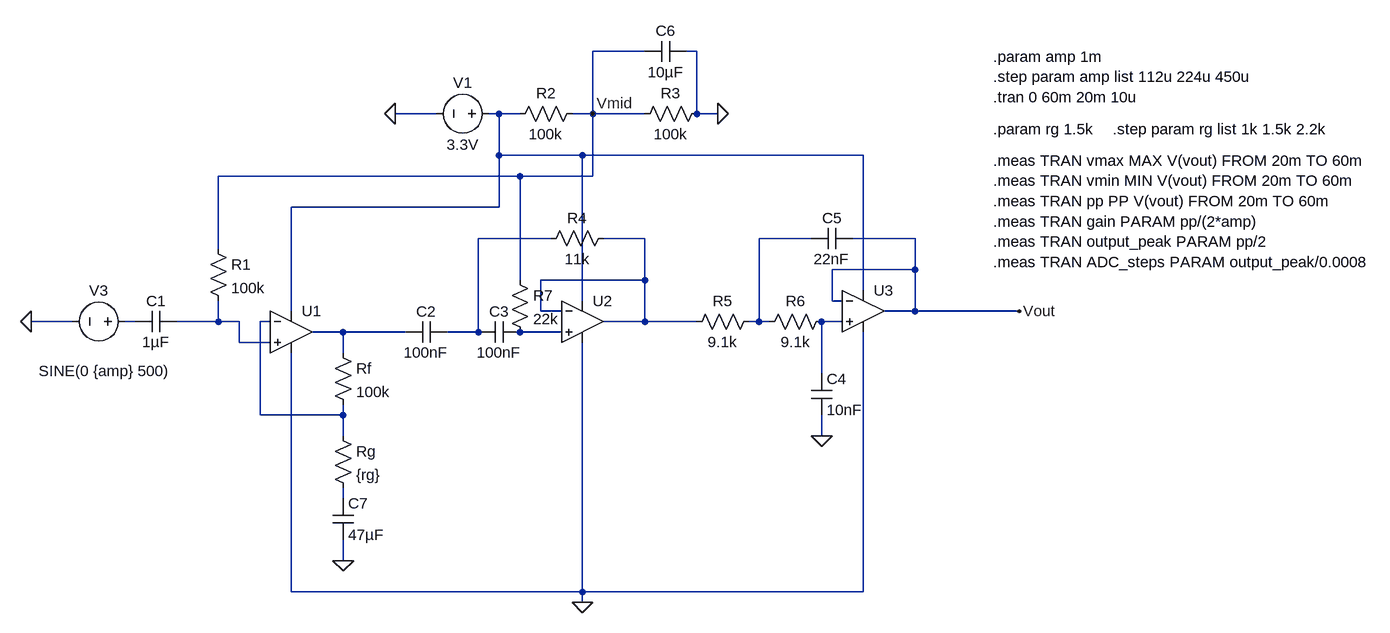
[diagram p0: schematic AUSCULT_AI_Filter - ADC step test with microvolts.asc]
AUSCULT_AI_Filter - ADC step test with microvolts.asc, the LTspice schematic file:
Version 4.1
SHEET 1 1760 680
WIRE 576 -272 496 -272
WIRE 656 -272 640 -272
WIRE 256 -176 192 -176
WIRE 352 -176 336 -176
WIRE 384 -176 352 -176
WIRE 496 -176 496 -272
WIRE 496 -176 464 -176
WIRE 576 -176 496 -176
WIRE 656 -176 656 -272
WIRE 688 -176 656 -176
WIRE 352 -112 352 -176
WIRE 480 -112 352 -112
WIRE 912 -112 480 -112
WIRE 384 -80 -80 -80
WIRE 496 -80 496 -176
WIRE 496 -80 384 -80
WIRE 352 -32 352 -112
WIRE 352 -32 32 -32
WIRE 432 16 320 16
WIRE 576 16 512 16
WIRE 832 16 752 16
WIRE 992 16 896 16
WIRE -80 32 -80 -80
WIRE 992 64 992 16
WIRE 992 64 864 64
WIRE 384 80 384 -80
WIRE 576 80 576 16
WIRE 576 80 416 80
WIRE 912 96 912 -112
WIRE 480 112 480 -112
WIRE 864 112 864 64
WIRE 880 112 864 112
WIRE 32 128 32 -32
WIRE 416 128 416 80
WIRE 448 128 416 128
WIRE 992 128 992 64
WIRE 992 128 944 128
WIRE 1152 128 992 128
WIRE -304 144 -368 144
WIRE -208 144 -224 144
WIRE -80 144 -80 112
WIRE -80 144 -144 144
WIRE -48 144 -80 144
WIRE 0 144 -16 144
WIRE 576 144 576 80
WIRE 576 144 512 144
WIRE 656 144 576 144
WIRE 752 144 752 16
WIRE 752 144 736 144
WIRE 768 144 752 144
WIRE 880 144 848 144
WIRE 112 160 64 160
WIRE 208 160 112 160
WIRE 320 160 320 16
WIRE 320 160 272 160
WIRE 448 160 384 160
WIRE -48 176 -48 144
WIRE 0 176 -48 176
WIRE 112 192 112 160
WIRE 848 224 848 144
WIRE -16 288 -16 144
WIRE 112 288 112 272
WIRE 112 288 -16 288
WIRE 112 320 112 288
WIRE 848 320 848 288
WIRE 112 416 112 400
WIRE 112 512 112 480
WIRE 32 560 32 192
WIRE 480 560 480 176
WIRE 480 560 32 560
WIRE 912 560 912 160
WIRE 912 560 480 560
WIRE 480 576 480 560
FLAG 848 320 0
FLAG 1152 128 Vout
FLAG -368 144 0
FLAG 480 576 0
FLAG 112 512 0
FLAG 688 -176 0
FLAG 496 -176 Vmid
FLAG 192 -176 0
SYMBOL OpAmps\\UniversalOpAmp2 32 160 R0
SYMATTR InstName U1
SYMBOL OpAmps\\UniversalOpAmp2 480 144 R0
SYMATTR InstName U2
SYMBOL OpAmps\\UniversalOpAmp2 912 128 R0
SYMATTR InstName U3
SYMBOL cap -144 128 R90
WINDOW 0 0 32 VBottom 2
WINDOW 3 32 32 VTop 2
SYMATTR InstName C1
SYMATTR Value 1µF
SYMBOL res -96 16 R0
SYMATTR InstName R1
SYMATTR Value 100k
SYMBOL res 96 176 R0
SYMATTR InstName Rf
SYMATTR Value 100k
SYMBOL res 96 304 R0
SYMATTR InstName Rg
SYMATTR Value {rg}
SYMBOL cap 272 144 R90
WINDOW 0 0 32 VBottom 2
WINDOW 3 32 32 VTop 2
SYMATTR InstName C2
SYMATTR Value 100nF
SYMBOL cap 384 144 R90
WINDOW 0 0 32 VBottom 2
WINDOW 3 32 32 VTop 2
SYMATTR InstName C3
SYMATTR Value 100nF
SYMBOL res 528 0 R90
WINDOW 0 0 56 VBottom 2
WINDOW 3 32 56 VTop 2
SYMATTR InstName R4
SYMATTR Value 11k
SYMBOL res 752 128 R90
WINDOW 0 0 56 VBottom 2
WINDOW 3 32 56 VTop 2
SYMATTR InstName R5
SYMATTR Value 9.1k
SYMBOL res 864 128 R90
WINDOW 0 0 56 VBottom 2
WINDOW 3 32 56 VTop 2
SYMATTR InstName R6
SYMATTR Value 9.1k
SYMBOL cap 832 224 R0
SYMATTR InstName C4
SYMATTR Value 10nF
SYMBOL cap 896 0 R90
WINDOW 0 0 32 VBottom 2
WINDOW 3 32 32 VTop 2
SYMATTR InstName C5
SYMATTR Value 22nF
SYMBOL res 368 64 R0
SYMATTR InstName R7
SYMATTR Value 22k
SYMBOL voltage -208 144 R90
WINDOW 0 -32 56 VBottom 2
WINDOW 3 60 47 VTop 2
WINDOW 123 47 49 VTop 2
WINDOW 39 0 0 Left 0
SYMATTR InstName V3
SYMATTR Value SINE(0 {amp} 500)
SYMBOL voltage 352 -176 R90
WINDOW 0 -32 56 VBottom 2
WINDOW 3 32 56 VTop 2
WINDOW 123 0 0 Left 0
WINDOW 39 0 0 Left 0
SYMATTR InstName V1
SYMATTR Value 3.3V
SYMBOL res 480 -192 R90
WINDOW 0 0 56 VBottom 2
WINDOW 3 32 56 VTop 2
SYMATTR InstName R2
SYMATTR Value 100k
SYMBOL res 672 -192 R90
WINDOW 0 0 56 VBottom 2
WINDOW 3 32 56 VTop 2
SYMATTR InstName R3
SYMATTR Value 100k
SYMBOL cap 640 -288 R90
WINDOW 0 0 32 VBottom 2
WINDOW 3 32 32 VTop 2
SYMATTR InstName C6
SYMATTR Value 10µF
SYMBOL cap 96 416 R0
SYMATTR InstName C7
SYMATTR Value 47µF
TEXT 1112 -264 Left 2 !.param amp 1m\n.step param amp list 112u 224u 450u\n.tran 0 60m 20m 10u
TEXT 1112 -104 Left 2 !.meas TRAN vmax MAX V(vout) FROM 20m TO 60m\n.meas TRAN vmin MIN V(vout) FROM 20m TO 60m\n.meas TRAN pp PP V(vout) FROM 20m TO 60m\n.meas TRAN gain PARAM pp/(2*amp)\n.meas TRAN output_peak PARAM pp/2\n.meas TRAN ADC_steps PARAM output_peak/0.0008
TEXT 1112 -152 Left 2 !.param rg 1.5k
TEXT 1296 -152 Left 2 !.step param rg list 1k 1.5k 2.2k

The netlist it stands for:
* AUSCULT_AI_Filter - ADC step test with microvolts.asc
X§U1 N006 N007 N001 0 N009 level2 Avol=1Meg GBW=10Meg Slew=10Meg Ilimit=25m Rail=0 Vos=0 En=0 Enk=0 In=0 Ink=0 Rin=500Meg  ; pins In+ In- V+ V- OUT
X§U2 N010 N003 N001 0 N003 level2 Avol=1Meg GBW=10Meg Slew=10Meg Ilimit=25m Rail=0 Vos=0 En=0 Enk=0 In=0 Ink=0 Rin=500Meg  ; pins In+ In- V+ V- OUT
X§U3 N008 Vout N001 0 Vout level2 Avol=1Meg GBW=10Meg Slew=10Meg Ilimit=25m Rail=0 Vos=0 En=0 Enk=0 In=0 Ink=0 Rin=500Meg  ; pins In+ In- V+ V- OUT
C1 N006 N005 1µF
R1 Vmid N006 100k
Rf N009 N007 100k
Rg N007 N011 {rg}
C2 N002 N009 100nF
C3 N010 N002 100nF
R4 N003 N002 11k
R5 N004 N003 9.1k
R6 N008 N004 9.1k
C4 N008 0 10nF
C5 Vout N004 22nF
R7 Vmid N010 22k
V3 N005 0 SINE(0 {amp} 500)
V1 N001 0 3.3V
R2 Vmid N001 100k
R3 0 Vmid 100k
C6 0 Vmid 10µF
C7 N011 0 47µF
.param amp 1m
.step param amp list 112u 224u 450u
.tran 0 60m 20m 10u
.meas TRAN vmax MAX V(vout) FROM 20m TO 60m
.meas TRAN vmin MIN V(vout) FROM 20m TO 60m
.meas TRAN pp PP V(vout) FROM 20m TO 60m
.meas TRAN gain PARAM pp/(2*amp)
.meas TRAN output_peak PARAM pp/2
.meas TRAN ADC_steps PARAM output_peak/0.0008
.param rg 1.5k
.step param rg list 1k 1.5k 2.2k
.lib UniversalOpAmp2.lib
.backanno
.end